# Altium project NotOnlyFans.PrjPcb
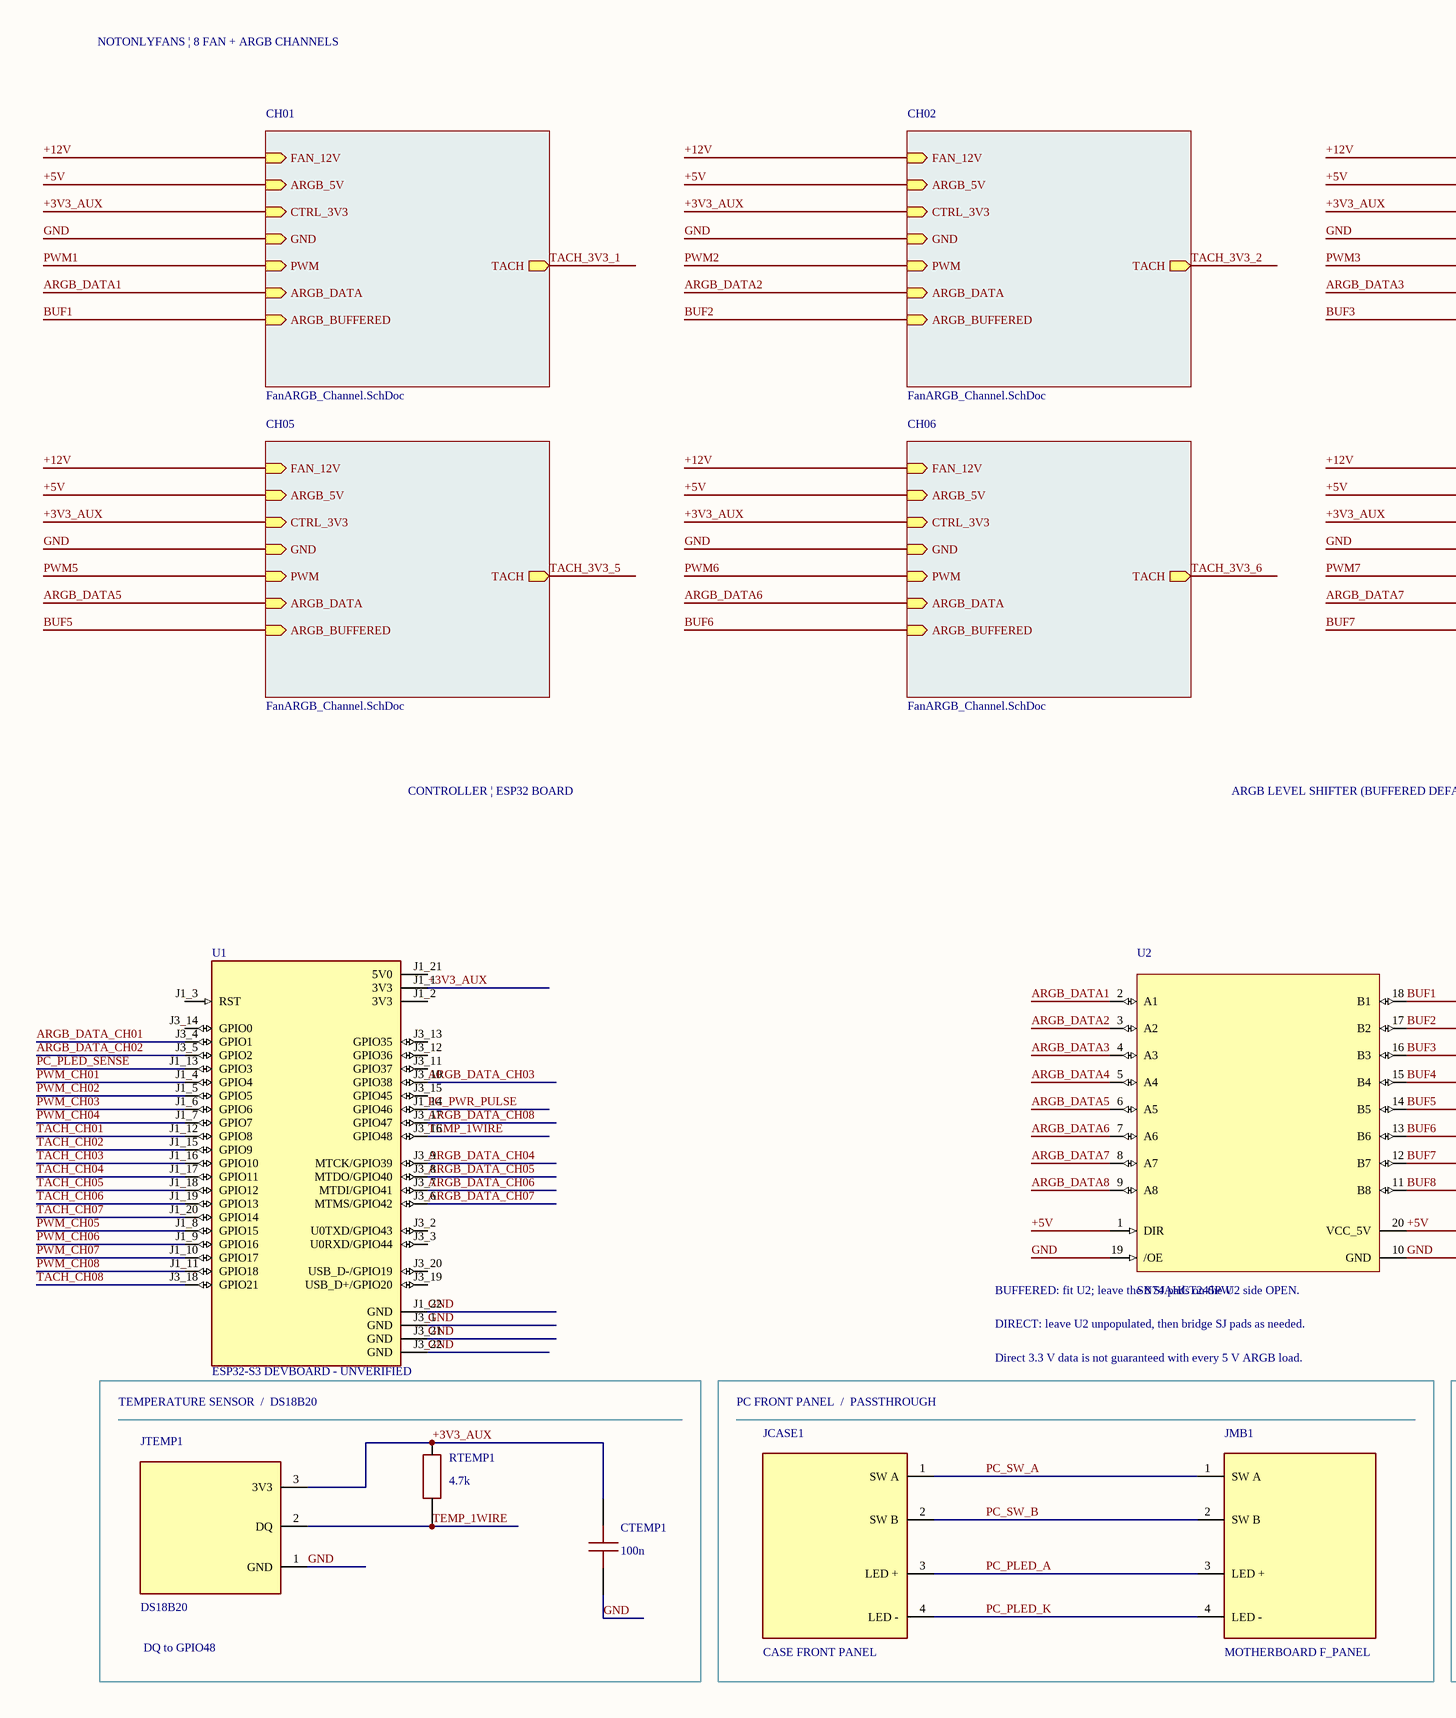
[diagram p0: Sheet1.SchDoc, left]
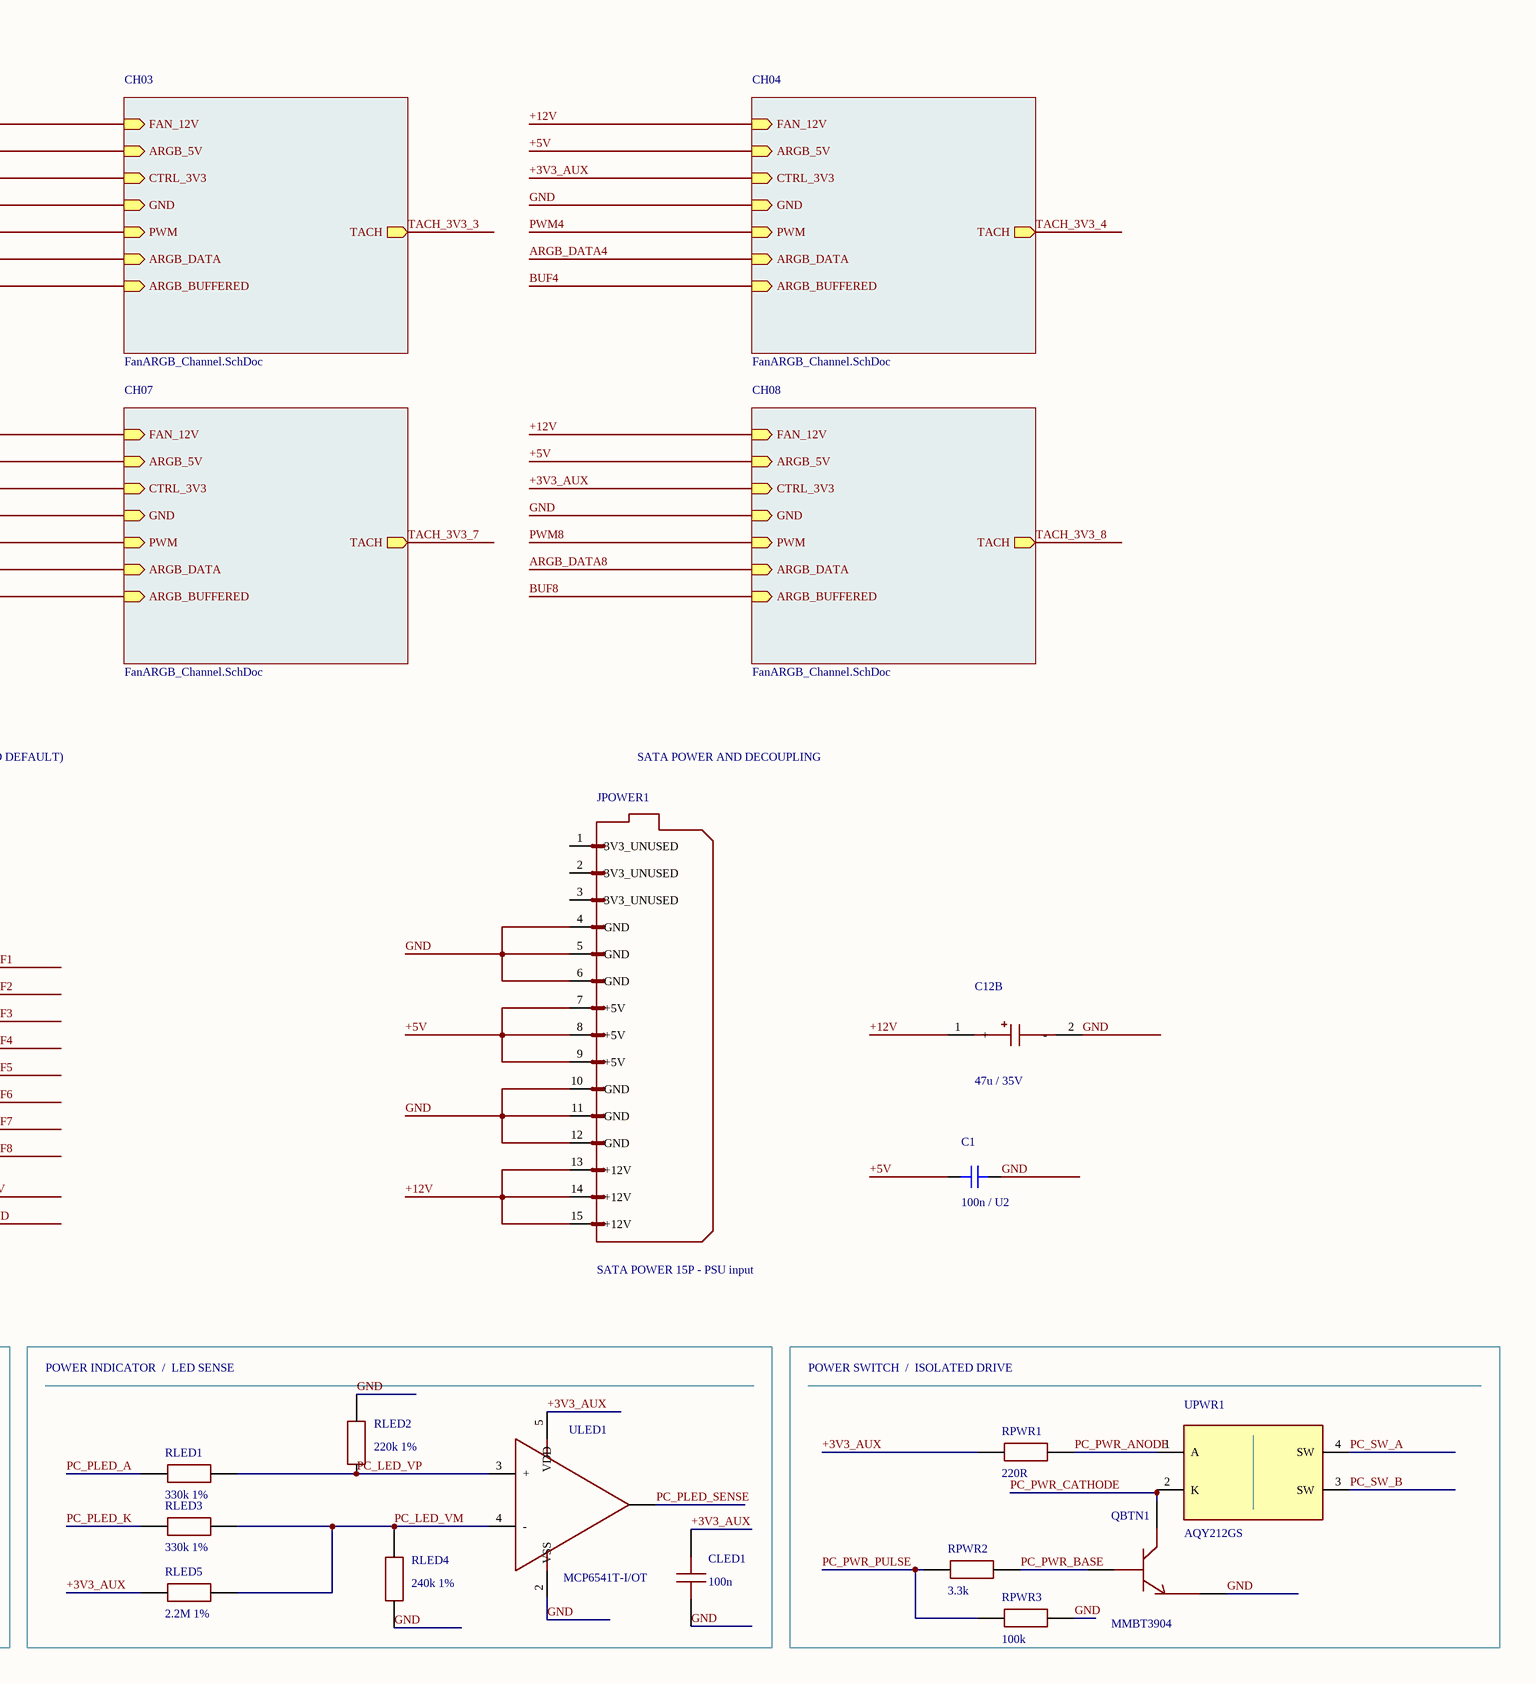
[diagram p1: Sheet1.SchDoc, right]
2 sheets, 190 parts. Net scope: hierarchical (ports join the sheet entries above them; power ports are global).
Board file: PCB1.PcbDoc
Sheets:
  Sheet1.SchDoc
    CH01 = FanARGB_Channel.SchDoc
    CH02 = FanARGB_Channel.SchDoc
    CH03 = FanARGB_Channel.SchDoc
    CH04 = FanARGB_Channel.SchDoc
    CH05 = FanARGB_Channel.SchDoc
    CH06 = FanARGB_Channel.SchDoc
    CH07 = FanARGB_Channel.SchDoc
    CH08 = FanARGB_Channel.SchDoc

## Sheet Sheet1.SchDoc
size A2; SheetNumber: 1; SheetTotal: 2

### Parts
C1  100n / U2  [CH0603C]
C12B  47u / 35V  [EEE_FK_D_6X6]
CLED1  100n  [CH0603C]
CTEMP1  100n  [CH0603C]
JCASE1  CASE FRONT PANEL  [TSW_104_08_S_RA]
JMB1  MOTHERBOARD F_PANEL  [TSW_104_08_S_RA]
JPOWER1  SATA POWER 15P - PSU input  [CSAT-M15RD30-PB]
JTEMP1  DS18B20  [B3B_PH_K_S_1X03]
QBTN1  MMBT3904  [MMBT3904_SOT23]
RLED1  330k 1%  [CH0603R]
RLED2  220k 1%  [CH0603R]
RLED3  330k 1%  [CH0603R]
RLED4  240k 1%  [CH0603R]
RLED5  2.2M 1%  [CH0603R]
RPWR1  220R  [CH0603R]
RPWR2  3.3k  [CH0603R]
RPWR3  100k  [CH0603R]
RTEMP1  4.7k  [CH0603R]
U1  ESP32-S3 DEVBOARD - UNVERIFIED  [YD-ESP32-S3_44P_25.40MM]
U2  SN74AHCT245PW  [TI TSSOP-20 PW]
ULED1  MCP6541T-I/OT  [SOT23_5_AUX]
UPWR1  AQY212GS  [AQY212GS_SOP4]

### Blocks framed on the sheet
PC FRONT PANEL  /  PASSTHROUGH: JCASE1 JMB1
POWER INDICATOR  /  LED SENSE: CLED1 RLED1-RLED5 ULED1
POWER SWITCH  /  ISOLATED DRIVE: QBTN1 RPWR1-RPWR3 UPWR1

### Sub-sheets
CH01 = FanARGB_Channel.SchDoc: FAN_12V (in), ARGB_5V (in), CTRL_3V3 (in), GND (in), PWM (in), ARGB_DATA (in), ARGB_BUFFERED (in), TACH (out)
CH02 = FanARGB_Channel.SchDoc: FAN_12V (in), ARGB_5V (in), CTRL_3V3 (in), GND (in), PWM (in), ARGB_DATA (in), ARGB_BUFFERED (in), TACH (out)
CH03 = FanARGB_Channel.SchDoc: FAN_12V (in), ARGB_5V (in), CTRL_3V3 (in), GND (in), PWM (in), ARGB_DATA (in), ARGB_BUFFERED (in), TACH (out)
CH04 = FanARGB_Channel.SchDoc: FAN_12V (in), ARGB_5V (in), CTRL_3V3 (in), GND (in), PWM (in), ARGB_DATA (in), ARGB_BUFFERED (in), TACH (out)
CH05 = FanARGB_Channel.SchDoc: FAN_12V (in), ARGB_5V (in), CTRL_3V3 (in), GND (in), PWM (in), ARGB_DATA (in), ARGB_BUFFERED (in), TACH (out)
CH06 = FanARGB_Channel.SchDoc: FAN_12V (in), ARGB_5V (in), CTRL_3V3 (in), GND (in), PWM (in), ARGB_DATA (in), ARGB_BUFFERED (in), TACH (out)
CH07 = FanARGB_Channel.SchDoc: FAN_12V (in), ARGB_5V (in), CTRL_3V3 (in), GND (in), PWM (in), ARGB_DATA (in), ARGB_BUFFERED (in), TACH (out)
CH08 = FanARGB_Channel.SchDoc: FAN_12V (in), ARGB_5V (in), CTRL_3V3 (in), GND (in), PWM (in), ARGB_DATA (in), ARGB_BUFFERED (in), TACH (out)

### Nets
+3V3_AUX: CLED1.1 CTEMP1.1 JTEMP1.3(3V3) RLED5.1 RPWR1.1 RTEMP1.1 U1.J1_1(3V3) ULED1.5(VDD) ; sheet CH01/CTRL_3V3, sheet CH02/CTRL_3V3, sheet CH03/CTRL_3V3, sheet CH04/CTRL_3V3, sheet CH05/CTRL_3V3, sheet CH06/CTRL_3V3, sheet CH07/CTRL_3V3, sheet CH08/CTRL_3V3
+5V: C1.1 JPOWER1.7(+5V) JPOWER1.8(+5V) JPOWER1.9(+5V) U2.1(DIR) U2.20(VCC_5V) ; sheet CH01/ARGB_5V, sheet CH02/ARGB_5V, sheet CH03/ARGB_5V, sheet CH04/ARGB_5V, sheet CH05/ARGB_5V, sheet CH06/ARGB_5V, sheet CH07/ARGB_5V, sheet CH08/ARGB_5V
+12V: C12B.1(+) JPOWER1.13(+12V) JPOWER1.14(+12V) JPOWER1.15(+12V) ; sheet CH01/FAN_12V, sheet CH02/FAN_12V, sheet CH03/FAN_12V, sheet CH04/FAN_12V, sheet CH05/FAN_12V, sheet CH06/FAN_12V, sheet CH07/FAN_12V, sheet CH08/FAN_12V
ARGB_DATA1: U2.2(A1) ; sheet CH01/ARGB_DATA  [project net ARGB_DATA]
ARGB_DATA2: U2.3(A2) ; sheet CH02/ARGB_DATA  [project net ARGB_DATA]
ARGB_DATA3: U2.4(A3) ; sheet CH03/ARGB_DATA  [project net ARGB_DATA]
ARGB_DATA4: U2.5(A4) ; sheet CH04/ARGB_DATA  [project net ARGB_DATA]
ARGB_DATA5: U2.6(A5) ; sheet CH05/ARGB_DATA  [project net ARGB_DATA]
ARGB_DATA6: U2.7(A6) ; sheet CH06/ARGB_DATA  [project net ARGB_DATA]
ARGB_DATA7: U2.8(A7) ; sheet CH07/ARGB_DATA  [project net ARGB_DATA]
ARGB_DATA8: U2.9(A8) ; sheet CH08/ARGB_DATA  [project net ARGB_DATA]
ARGB_DATA_CH01: U1.J3_4(GPIO1)
ARGB_DATA_CH02: U1.J3_5(GPIO2)
ARGB_DATA_CH03: U1.J3_10(GPIO38)
ARGB_DATA_CH04: U1.J3_9(MTCK/GPIO39)
ARGB_DATA_CH05: U1.J3_8(MTDO/GPIO40)
ARGB_DATA_CH06: U1.J3_7(MTDI/GPIO41)
ARGB_DATA_CH07: U1.J3_6(MTMS/GPIO42)
ARGB_DATA_CH08: U1.J3_17(GPIO47)
BUF1: U2.18(B1) ; sheet CH01/ARGB_BUFFERED  [project net ARGB_BUFFERED]
BUF2: U2.17(B2) ; sheet CH02/ARGB_BUFFERED  [project net ARGB_BUFFERED]
BUF3: U2.16(B3) ; sheet CH03/ARGB_BUFFERED  [project net ARGB_BUFFERED]
BUF4: U2.15(B4) ; sheet CH04/ARGB_BUFFERED  [project net ARGB_BUFFERED]
BUF5: U2.14(B5) ; sheet CH05/ARGB_BUFFERED  [project net ARGB_BUFFERED]
BUF6: U2.13(B6) ; sheet CH06/ARGB_BUFFERED  [project net ARGB_BUFFERED]
BUF7: U2.12(B7) ; sheet CH07/ARGB_BUFFERED  [project net ARGB_BUFFERED]
BUF8: U2.11(B8) ; sheet CH08/ARGB_BUFFERED  [project net ARGB_BUFFERED]
GND: C1.2 C12B.2(-) CLED1.2 CTEMP1.2 JPOWER1.4(GND) JPOWER1.5(GND) JPOWER1.6(GND) JPOWER1.10(GND) JPOWER1.11(GND) JPOWER1.12(GND) JTEMP1.1(GND) QBTN1.2 RLED2.2 RLED4.2 RPWR3.2 U1.J1_22(GND) U1.J3_1(GND) U1.J3_21(GND) U1.J3_22(GND) U2.10(GND) U2.19(/OE) ULED1.2(VSS) ; sheet CH01/GND, sheet CH02/GND, sheet CH03/GND, sheet CH04/GND, sheet CH05/GND, sheet CH06/GND, sheet CH07/GND, sheet CH08/GND
PC_LED_VM: RLED3.2 RLED4.1 RLED5.2 ULED1.4(-)
PC_LED_VP: RLED1.2 RLED2.1 ULED1.3(+)
PC_PLED_A: JCASE1.3(LED_+) JMB1.3(LED_+) RLED1.1
PC_PLED_K: JCASE1.4(LED_-) JMB1.4(LED_-) RLED3.1
PC_PLED_SENSE: U1.J1_13(GPIO3) ULED1.1
PC_PWR_ANODE: RPWR1.2 UPWR1.1(A)
PC_PWR_BASE: QBTN1.1 RPWR2.2
PC_PWR_CATHODE: QBTN1.3 UPWR1.2(K)
PC_PWR_PULSE: RPWR2.1 RPWR3.1 U1.J1_14(GPIO46)
PC_SW_A: JCASE1.1(SW_A) JMB1.1(SW_A) UPWR1.4(SW)
PC_SW_B: JCASE1.2(SW_B) JMB1.2(SW_B) UPWR1.3(SW)
PWM_CH01: U1.J1_4(GPIO4)
PWM_CH02: U1.J1_5(GPIO5)
PWM_CH03: U1.J1_6(GPIO6)
PWM_CH04: U1.J1_7(GPIO7)
PWM_CH05: U1.J1_8(GPIO15)
PWM_CH06: U1.J1_9(GPIO16)
PWM_CH07: U1.J1_10(GPIO17)
PWM_CH08: U1.J1_11(GPIO18)
TACH_CH01: U1.J1_12(GPIO8)
TACH_CH02: U1.J1_15(GPIO9)
TACH_CH03: U1.J1_16(GPIO10)
TACH_CH04: U1.J1_17(GPIO11)
TACH_CH05: U1.J1_18(GPIO12)
TACH_CH06: U1.J1_19(GPIO13)
TACH_CH07: U1.J1_20(GPIO14)
TACH_CH08: U1.J3_18(GPIO21)
TEMP_1WIRE: JTEMP1.2(DQ) RTEMP1.2 U1.J3_16(GPIO48)

Not connected (* = marked no-connect by the designer): JPOWER1 1(3V3_UNUSED) 2(3V3_UNUSED) 3(3V3_UNUSED); U1 J1_2(3V3) J1_3(RST) J1_21(5V0) J3_2(U0TXD/GPIO43) J3_3(U0RXD/GPIO44) J3_11(GPIO37) J3_12(GPIO36) J3_13(GPIO35) J3_14(GPIO0) J3_15(GPIO45) J3_19(USB_D+/GPIO20) J3_20(USB_D-/GPIO19)

### Notes on the sheet
- NOTONLYFANS | 8 FAN + ARGB CHANNELS
- CONTROLLER | ESP32 BOARD
- ARGB LEVEL SHIFTER (BUFFERED DEFAULT)
- SATA POWER AND DECOUPLING
- (near U2) BUFFERED: fit U2; leave the 8 SJ pads on the U2 side OPEN.
- DIRECT: leave U2 unpopulated, then bridge SJ pads as needed.
- Direct 3.3 V data is not guaranteed with every 5 V ARGB load.
- (near U1) TEMPERATURE SENSOR  /  DS18B20
- DQ to GPIO48

### Library data of the parts
C1 = Capacitor: 100nF U2 bypass per TI section 9.3; connect +5V to GND, place close to U2 VCC/GND in future PCB; voltage rating and package TBD.
C12B = AUTHORED_POLAR_C: AUTHORED native symbol; verified electrical pin IDs per tools/PWM_TOPOLOGY.md; no approved footprint; Manufacturer Part Number: EEE-FK1V470P; Provenance: AUTHORED; datasheet pin identity in tools/PWM_TOPOLOGY.md
CLED1 CTEMP1 = CAP_100n
JCASE1 JMB1 = TSW-104-07-T-S: Manufacturer Part Number: TSW-104-08-T-S-RA
JPOWER1 = CUSTOM_SATA_POWER_15: Conn-Link CSAT-M15RD30-PB, 15-pin SATA power input, right-angle through-hole plug.
JTEMP1 = B3B-PH-K-S(LF)(SN): Manufacturer Part Number: B3B-PH-K-S(LF)(SN)
QBTN1 = MMBT3904LT1G: Manufacturer Part Number: MMBT3904LT1G
RLED1 RLED3 = RES_330k_1%
RLED2 = RES_220k_1%
RLED4 = RES_240k_1%
RLED5 = RES_2.2M_1%
RPWR1 = RES_220R
RPWR2 = RES_3.3k
RPWR3 = RES_100k
RTEMP1 = RES_4.7k
U1 = ESP32-S3-DEVKITC-1-N16R8V: Existing DevKitC symbol retained only as provisional whole-board stand-in. Twin-USB-C board identity, header pinout and footprint UNVERIFIED.; MF: Espressif Systems; SnapEDA_Link: https://www.snapeda.com/parts/ESP32-S3-DEVKITC-1-N16R8V/Espressif+Systems/view-part/?ref=snap; Package: None; Value: *; MP: ESP32-S3-DEVKITC-1-N16R8V; Check_prices: https://www.snapeda.com/parts/ESP32-S3-DEVKITC-1-N16R8V/Espressif+Systems/view-part/?ref=eda
U2 = CUSTOM_SN74AHCT245: Default ARGB buffer. Leave the eight top-side SJ bridges open when U2 is fitted.; DefaultPopulation: FITTED; AssemblyOption: BUFFERED only; every SJ open
ULED1 = MCP6541T-I/OT: Manufacturer Part Number: MCP6541T-I/OT
UPWR1 = AQY212GS: Manufacturer Part Number: AQY212GS

## Sheet FanARGB_Channel.SchDoc
size A3; SheetNumber: 2; SheetTotal: 2
Used 8 times, as channels CH01, CH02, CH03, CH04, CH05, CH06, CH07, CH08. Parts and nets are listed once, with the designators drawn on the sheet.
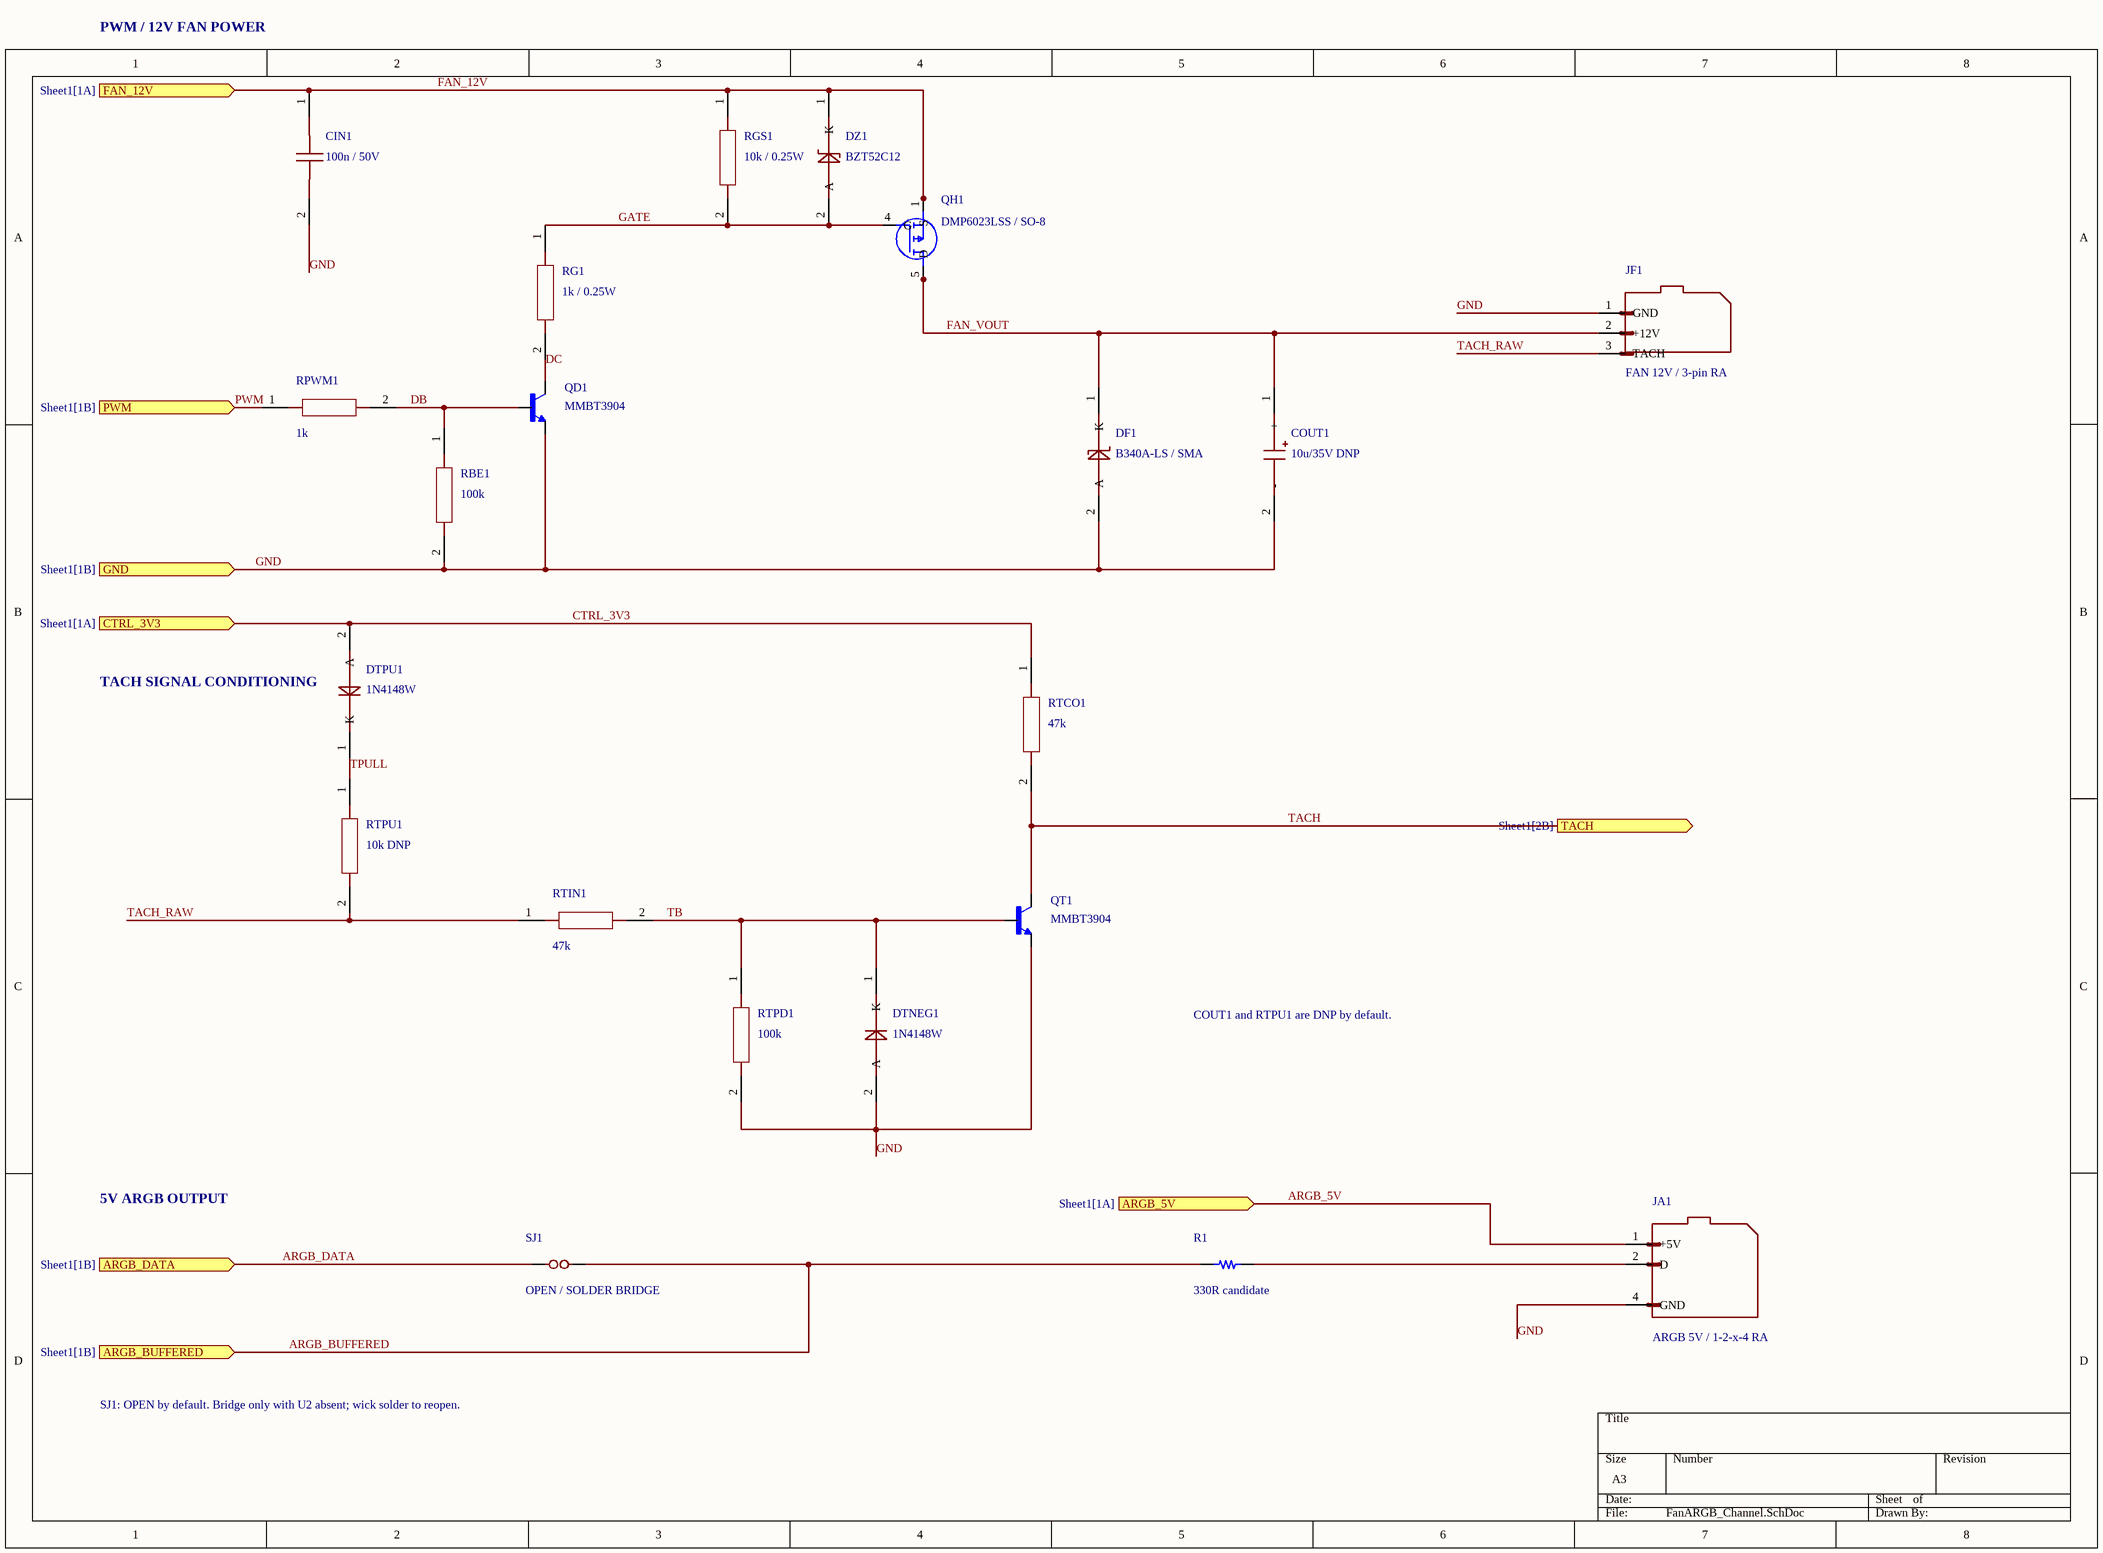
[diagram p2: FanARGB_Channel.SchDoc]

### Parts
CIN1  100n / 50V  [CH0603C]
COUT1  10u/35V DNP  [EEE_FK_5x5_8]
DF1  B340A-LS / SMA  [B340ALS_DIODES_SMA]
DTNEG1  1N4148W  [D_SOD123_DIODESINC]
DTPU1  1N4148W  [D_SOD123_DIODESINC]
DZ1  BZT52C12  [D_SOD123_DIODESINC]
JA1  ARGB 5V / 1-2-x-4 RA  [TSW_104_08_S_RA_003_ARGB]
JF1  FAN 12V / 3-pin RA  [Molex_22053031_RA]
QD1  MMBT3904  [MMBT3904_SOT23]
QH1  DMP6023LSS / SO-8  [DMP6023LSS_SO8]
QT1  MMBT3904  [MMBT3904_SOT23]
R1  330R candidate  [CH0603R]
RBE1  100k  [CH0603R]
RG1  1k / 0.25W  [CH1206R]
RGS1  10k / 0.25W  [CH1206R]
RPWM1  1k  [CH0603R]
RTCO1  47k  [CH0603R]
RTIN1  47k  [CH0603R]
RTPD1  100k  [CH0603R]
RTPU1  10k DNP  [CH0603R]
SJ1  OPEN / SOLDER BRIDGE  [SJ_RECT_125X095_G030]  (no BOM)

### Ports
ARGB_5V (in, see Sheet1[1A]), ARGB_BUFFERED (in, see Sheet1[1B]), ARGB_DATA (in, see Sheet1[1B]), CTRL_3V3 (in, see Sheet1[1A]), FAN_12V (in, see Sheet1[1A]), GND (in, see Sheet1[1B]), PWM (in, see Sheet1[1B]), TACH (out, see Sheet1[2B])

### Nets
ARGB_5V: JA1.1(+5V) ; port ARGB_5V
ARGB_BUFFERED: R1.1 SJ1.2 ; port ARGB_BUFFERED
ARGB_DATA: SJ1.1 ; port ARGB_DATA
CTRL_3V3: DTPU1.2(A) RTCO1.1 ; port CTRL_3V3
DB: QD1.1(B) RBE1.1 RPWM1.2
DC: QD1.3(C) RG1.2
FAN_12V: CIN1.1 DZ1.1(K) QH1.1(S) QH1.2(S) QH1.3(S) RGS1.1 ; port FAN_12V
FAN_VOUT: COUT1.1(+) DF1.1(K) JF1.2(+12V) QH1.5(D) QH1.6(D) QH1.7(D) QH1.8(D)
GATE: DZ1.2(A) QH1.4(G) RG1.1 RGS1.2
GND: CIN1.2 COUT1.2(-) DF1.2(A) DTNEG1.2(A) JA1.4(GND) JF1.1(GND) QD1.2(E) QT1.2(E) RBE1.2 RTPD1.2 ; port GND
PWM: RPWM1.1 ; port PWM
TACH: QT1.3(C) RTCO1.2 ; port TACH
TACH_RAW: JF1.3(TACH) RTIN1.1 RTPU1.2
TB: DTNEG1.1(K) QT1.1(B) RTIN1.2 RTPD1.1
TPULL: DTPU1.1(K) RTPU1.1
NetJA1_2: JA1.2(D) R1.2

### Channels
CH01: designators end in _CH01; ports ARGB_5V=+5V ARGB_BUFFERED=ARGB_BUFFERED ARGB_DATA=ARGB_DATA CTRL_3V3=+3V3_AUX FAN_12V=+12V GND=GND PWM=PWM_CH01 TACH=TACH_CH01
CH02: designators end in _CH02; ports ARGB_5V=+5V ARGB_BUFFERED=ARGB_BUFFERED ARGB_DATA=ARGB_DATA CTRL_3V3=+3V3_AUX FAN_12V=+12V GND=GND PWM=PWM_CH02 TACH=TACH_CH02
CH03: designators end in _CH03; ports ARGB_5V=+5V ARGB_BUFFERED=ARGB_BUFFERED ARGB_DATA=ARGB_DATA CTRL_3V3=+3V3_AUX FAN_12V=+12V GND=GND PWM=PWM_CH03 TACH=TACH_CH03
CH04: designators end in _CH04; ports ARGB_5V=+5V ARGB_BUFFERED=ARGB_BUFFERED ARGB_DATA=ARGB_DATA CTRL_3V3=+3V3_AUX FAN_12V=+12V GND=GND PWM=PWM_CH04 TACH=TACH_CH04
CH05: designators end in _CH05; ports ARGB_5V=+5V ARGB_BUFFERED=ARGB_BUFFERED ARGB_DATA=ARGB_DATA CTRL_3V3=+3V3_AUX FAN_12V=+12V GND=GND PWM=PWM_CH05 TACH=TACH_CH05
CH06: designators end in _CH06; ports ARGB_5V=+5V ARGB_BUFFERED=ARGB_BUFFERED ARGB_DATA=ARGB_DATA CTRL_3V3=+3V3_AUX FAN_12V=+12V GND=GND PWM=PWM_CH06 TACH=TACH_CH06
CH07: designators end in _CH07; ports ARGB_5V=+5V ARGB_BUFFERED=ARGB_BUFFERED ARGB_DATA=ARGB_DATA CTRL_3V3=+3V3_AUX FAN_12V=+12V GND=GND PWM=PWM_CH07 TACH=TACH_CH07
CH08: designators end in _CH08; ports ARGB_5V=+5V ARGB_BUFFERED=ARGB_BUFFERED ARGB_DATA=ARGB_DATA CTRL_3V3=+3V3_AUX FAN_12V=+12V GND=GND PWM=PWM_CH08 TACH=TACH_CH08

### Notes on the sheet
- PWM / 12V FAN POWER
- TACH SIGNAL CONDITIONING
- COUT1 and RTPU1 are DNP by default.
- 5V ARGB OUTPUT
- SJ1: OPEN by default. Bridge only with U2 absent; wick solder to reopen.

### Library data of the parts
CIN1 = AUTHORED_C: AUTHORED native symbol; verified electrical pin IDs per tools/PWM_TOPOLOGY.md; no approved footprint; Provenance: AUTHORED; datasheet pin identity in tools/PWM_TOPOLOGY.md
COUT1 = AUTHORED_POLAR_C: Aluminum electrolytic capacitor, 10uF 35V, 5x5.8 mm, DNP; Manufacturer: Panasonic; Manufacturer Part Number: EEE-FK1V100R; Provenance: AUTHORED; datasheet pin identity in tools/PWM_TOPOLOGY.md; DefaultPopulation: DNP; Package: SMD electrolytic dia 5 mm; Datasheet: https://industrial.panasonic.com/ww/products/pt/aluminum-cap-smd/models/EEEFK1V100R
DF1 = AUTHORED_SCHOTTKY: B340A-LS Schottky rectifier 40 V 3 A SMA, pin 1 cathode; Manufacturer: Diodes Incorporated; Provenance: AUTHORED; datasheet pin identity in tools/PWM_TOPOLOGY.md; Manufacturer Part Number: B340A-LS; Package: SMA / DO-214AC; Datasheet: https://www.diodes.com/datasheet/download/B340A%28LS%29.pdf
DTNEG1 DTPU1 = AUTHORED_DIODE: Small-signal switching diode, SOD-123, cathode pad 1; Manufacturer: Diodes Incorporated; Manufacturer Part Number: 1N4148W-7-F; Provenance: AUTHORED; datasheet pin identity in tools/PWM_TOPOLOGY.md; Package: SOD-123; Datasheet: https://www.diodes.com/datasheet/download/1N4148W.pdf
DZ1 = AUTHORED_ZENER: 12V Zener diode, SOD-123, cathode pad 1; Manufacturer: Diodes Incorporated; Manufacturer Part Number: BZT52C12-7-F; Provenance: AUTHORED; datasheet pin identity in tools/PWM_TOPOLOGY.md; Package: SOD-123; Datasheet: https://www.diodes.com/datasheet/download/BZT52Cxx.pdf
JA1 = CUSTOM_ARGB_KEYED: Samtec TSW-104-08-L-S-RA-003, right-angle 5V ARGB header with pin 3 omitted; Manufacturer: Samtec; Manufacturer Part Number: TSW-104-08-L-S-RA-003; Package: THT right-angle, 2.54 mm, position 3 omitted; Datasheet: https://suddendocs.samtec.com/prints/tsw-xxx-xx-xxx-x-xx-xxx-mkt.pdf
JF1 = CUSTOM_FAN_3PIN: Molex KK 254 Series 7478 friction-lock right-angle fan header, three through-hole pins; Manufacturer: Molex; Manufacturer Part Number: 22-05-3031; Package: KK 254, right angle, THT; Datasheet: https://www.molex.com/en-us/products/part-detail/0022053031
QD1 QT1 = MMBT3904LT1G: NPN BJT 40V 200mA, SOT-23, B1 E2 C3; Manufacturer: onsemi; Value: *; Manufacturer Part Number: MMBT3904LT1G; Package: SOT-23; Datasheet: https://www.onsemi.com/pdf/datasheet/mmbt3904lt1-d.pdf
QH1 = DMP6023LSS-13: P-channel MOSFET -60 V, 25 mOhm at -10 V, in SO-8; S1-3 G4 D5-8; Manufacturer: Diodes Incorporated; Manufacturer Part Number: DMP6023LSS-13; Package: SO-8; Datasheet: https://www.diodes.com/datasheet/download/DMP6023LSS.pdf
R1 = Resistor: SMT Resistor
RBE1 RPWM1 RTCO1 RTIN1 RTPD1 = AUTHORED_R: AUTHORED native symbol; verified electrical pin IDs per tools/PWM_TOPOLOGY.md; no approved footprint; Provenance: AUTHORED; datasheet pin identity in tools/PWM_TOPOLOGY.md
RG1 = AUTHORED_R: 1k 1% 0.25W at 70C, 1206 resistor; Manufacturer: Yageo; Manufacturer Part Number: RC1206FR-071KL; Provenance: AUTHORED; datasheet pin identity in tools/PWM_TOPOLOGY.md; Package: 1206; Datasheet: https://yageogroup.com/component-documentation/download/specsheet/RC1206FR-071KL
RGS1 = AUTHORED_R: 10k 1% 0.25W at 70C, 1206 resistor; Manufacturer: Yageo; Manufacturer Part Number: RC1206FR-0710KL; Provenance: AUTHORED; datasheet pin identity in tools/PWM_TOPOLOGY.md; Package: 1206; Datasheet: https://yageogroup.com/component-documentation/download/specsheet/RC1206FR-0710KL
RTPU1 = AUTHORED_R: AUTHORED native symbol; verified electrical pin IDs per tools/PWM_TOPOLOGY.md; no approved footprint; Provenance: AUTHORED; datasheet pin identity in tools/PWM_TOPOLOGY.md; DefaultPopulation: DNP
SJ1 = SolderJumper_Open_2: Normally open solder pads. Bridge only when U2 is not installed. Remove solder to open.; DefaultPopulation: OPEN - PCB pads only; AssemblyOption: BUFFERED: leave open; DIRECT: U2 absent, hand-bridge pads; Value: OPEN

## Nets that join several sheets
+3V3_AUX: Sheet1 (8 pins), CH01 (DTPU1_CH01.2 RTCO1_CH01.1), CH02 (DTPU1_CH02.2 RTCO1_CH02.1), CH03 (DTPU1_CH03.2 RTCO1_CH03.1), CH04 (DTPU1_CH04.2 RTCO1_CH04.1), CH05 (DTPU1_CH05.2 RTCO1_CH05.1), CH06 (DTPU1_CH06.2 RTCO1_CH06.1), CH07 (DTPU1_CH07.2 RTCO1_CH07.1), CH08 (DTPU1_CH08.2 RTCO1_CH08.1)
+5V: Sheet1 (6 pins), CH01 (JA1_CH01.1), CH02 (JA1_CH02.1), CH03 (JA1_CH03.1), CH04 (JA1_CH04.1), CH05 (JA1_CH05.1), CH06 (JA1_CH06.1), CH07 (JA1_CH07.1), CH08 (JA1_CH08.1)
+12V: Sheet1 (C12B.1 JPOWER1.13 JPOWER1.14 JPOWER1.15), CH01 (6 pins), CH02 (6 pins), CH03 (6 pins), CH04 (6 pins), CH05 (6 pins), CH06 (6 pins), CH07 (6 pins), CH08 (6 pins)
ARGB_BUFFERED: Sheet1 (U2.18), CH01 (R1_CH01.1 SJ1_CH01.2)
ARGB_BUFFERED: Sheet1 (U2.17), CH02 (R1_CH02.1 SJ1_CH02.2)
ARGB_BUFFERED: Sheet1 (U2.16), CH03 (R1_CH03.1 SJ1_CH03.2)
ARGB_BUFFERED: Sheet1 (U2.15), CH04 (R1_CH04.1 SJ1_CH04.2)
ARGB_BUFFERED: Sheet1 (U2.14), CH05 (R1_CH05.1 SJ1_CH05.2)
ARGB_BUFFERED: Sheet1 (U2.13), CH06 (R1_CH06.1 SJ1_CH06.2)
ARGB_BUFFERED: Sheet1 (U2.12), CH07 (R1_CH07.1 SJ1_CH07.2)
ARGB_BUFFERED: Sheet1 (U2.11), CH08 (R1_CH08.1 SJ1_CH08.2)
ARGB_DATA: Sheet1 (U2.2), CH01 (SJ1_CH01.1)
ARGB_DATA: Sheet1 (U2.3), CH02 (SJ1_CH02.1)
ARGB_DATA: Sheet1 (U2.4), CH03 (SJ1_CH03.1)
ARGB_DATA: Sheet1 (U2.5), CH04 (SJ1_CH04.1)
ARGB_DATA: Sheet1 (U2.6), CH05 (SJ1_CH05.1)
ARGB_DATA: Sheet1 (U2.7), CH06 (SJ1_CH06.1)
ARGB_DATA: Sheet1 (U2.8), CH07 (SJ1_CH07.1)
ARGB_DATA: Sheet1 (U2.9), CH08 (SJ1_CH08.1)
GND: Sheet1 (22 pins), CH01 (10 pins), CH02 (10 pins), CH03 (10 pins), CH04 (10 pins), CH05 (10 pins), CH06 (10 pins), CH07 (10 pins), CH08 (10 pins)